# Altium project Input_Borad.PrjPcb
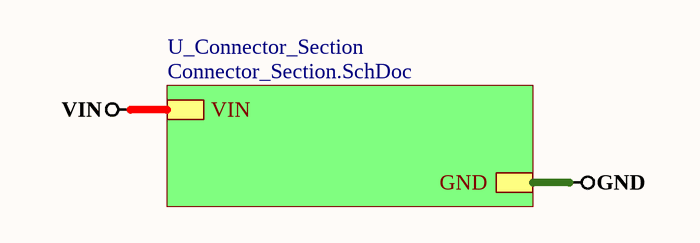
[diagram p0: Top_Sheet.SchDoc]
2 sheets, 3 parts. Net scope: hierarchical (ports join the sheet entries above them; power ports are global).
Board file: Input_Borad.PcbDoc
Sheets:
  Top_Sheet.SchDoc
    U_Connector_Section = Connector_Section.SchDoc

## Sheet Top_Sheet.SchDoc
size A4

### Sub-sheets
U_Connector_Section = Connector_Section.SchDoc: VIN, GND

## Sheet Connector_Section.SchDoc
size A4
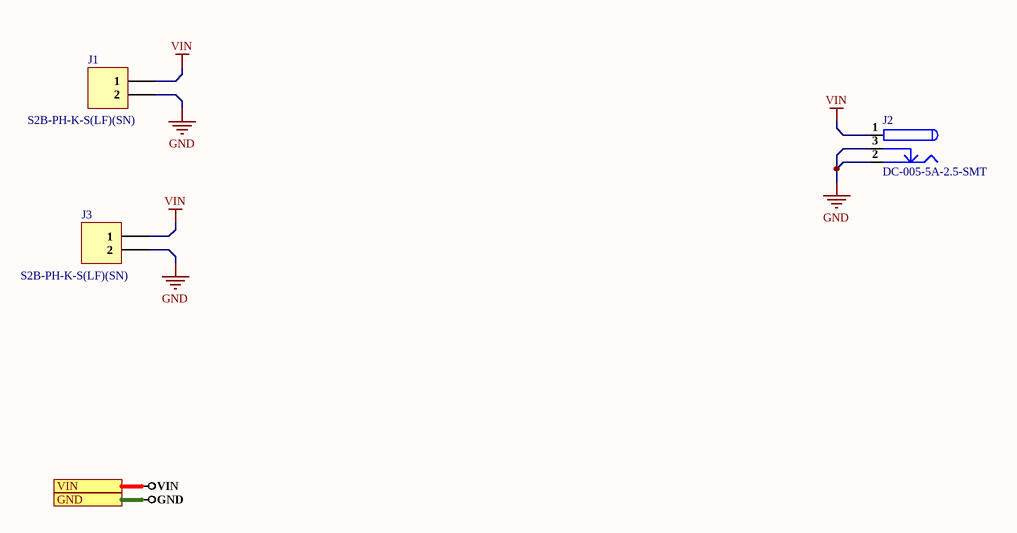
[diagram p1: Connector_Section.SchDoc]

### Parts
J1  S2B-PH-K-S(LF)(SN)  [S2B-PH-K-S(LF)(SN)]
J2  DC-005-5A-2.5-SMT  [DC-005-5A-2.5-SMT]
J3  S2B-PH-K-S(LF)(SN)  [S2B-PH-K-S(LF)(SN)]

### Ports
GND, VIN

### Nets
GND: J1.2 J2.2 J2.3 J3.2 ; port GND
VIN: J1.1 J2.1 J3.1 ; port VIN

### Library data of the parts
J1 J3 = S2B-PH-K-S(LF)(SN): Conn Shrouded Header (4 Sides) HDR 2 POS 2mm Solder RA Thru-Hole Box; Manufacturer: JST; Current Rating: 2A; Contact Resistance: 20mR; Voltage Rating: 100V; Number of Positions: 2; Gender: Male; Connector Type: Male Pin; Insulation Resistance: 1GR; Supplier 1: Future Electronics; Manufacturer Part Number: S2B-PH-K-S(LF)(SN); RoHS: Yes; Category: Headers and Wire Housings; Stock 1: 156269; Pricing 1: 1=0.07140, 500=0.06210, 2000=0.06020, 5000=0.05890, 20000=0.05710 (USD); Mount: Through Hole; Number of Pins: 2; Contact Material: Tin,Brass,Bronze; Contact Plating: Tin,Copper; Color: Natural,White; Housing Color: White; Housing Material: Polyamide; Min Operating Temperature: -25°C; Max Operating Temperature: 85°C; Max Current Rating: 2A; Number of Rows: 1; Packaging: Bulk; Termination: Solder; Fastening Type: Detent; Number of Contacts: 2; Max Voltage Rating (AC): 100V; Orientation: Right Angle; Series: PH; Contact Type: Male Pin; Number of Poles: 2; Voltage Rating (AC): 100V; Max Voltage Rating (DC): 100V; Working Voltage: 100V; Length: 5.9mm; Width: 4.5mm; Height: 9.4mm; Pitch: 2mm; Contact Mating Length: 0.13inch; Depth: 7.6mm; Lead Pitch: 2mm; REACH SVHC: No SVHC; Lead Free: Lead Free; Flammability Rating: UL94 V-0; ComponentLink1URL: https://datasheet.ciiva.com/11747/0900766b8082f558-11747128.pdf?src-supplier=RSComponents; ComponentLink1Description: https://datasheet.ciiva.com/11747/0900766b8082f558-11747128.pdf?src-supplier=RSComponents; ComponentLink2URL: https://datasheet.ciiva.com/712/eph-712447.pdf?src-supplier=Digi-Key; ComponentLink2Description: https://datasheet.ciiva.com/712/eph-712447.pdf?src-supplier=Digi-Key; ComponentLink3URL: https://datasheet.ciiva.com/8052/80564-8052207.pdf?src-supplier=Element14; ComponentLink3Description: https://datasheet.ciiva.com/8052/80564-8052207.pdf?src-supplier=Element14; ComponentLink4URL: https://datasheet.ciiva.com/16484/s2b-ph-k-slfsn-16484405.pdf?src-supplier=Future+Electronics; ComponentLink4Description: https://datasheet.ciiva.com/16484/s2b-ph-k-slfsn-16484405.pdf?src-supplier=Future+Electronics; ComponentLink5URL: https://datasheet.ciiva.com/26894/getdatasheetpartid-641020-26894599.pdf?src-supplier=Verical; ComponentLink5Description: https://datasheet.ciiva.com/26894/getdatasheetpartid-641020-26894599.pdf?src-supplier=Verical; Supplier Part Number 1: 7754757
J2 = DC-005-5A-2.5-SMT: DC Power Receptacle Jack 2.5A 2.5mm 6.5mm SMD Power Connectors RoHS; Manufacturer: XKB Enterprise; Value: Custom; Manufacturer Part No: DC-005-5A-2.5-SMT; Package: Custom